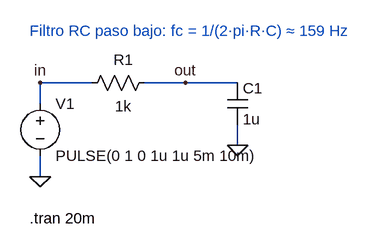
[diagram p0: schematic RC paso bajo.asc]
RC paso bajo.asc, the LTspice schematic file:
Version 4
SHEET 1 880 680
WIRE 80 0 0 0
WIRE 304 0 160 0
WIRE 0 32 0 0
WIRE 304 96 304 64
WIRE 0 144 0 112
FLAG 0 144 0
FLAG 304 96 0
FLAG 0 0 in
FLAG 224 0 out
SYMBOL voltage 0 16 R0
SYMATTR InstName V1
SYMATTR Value PULSE(0 1 0 1u 1u 5m 10m)
SYMBOL res 64 16 R270
WINDOW 0 36 64 VTop 2
WINDOW 3 -4 64 VBottom 2
SYMATTR InstName R1
SYMATTR Value 1k
SYMBOL cap 288 0 R0
SYMATTR InstName C1
SYMATTR Value 1u
TEXT -16 208 Left 2 !.tran 20m
TEXT -16 -80 Left 2 ;Filtro RC paso bajo: fc = 1/(2·pi·R·C) ≈ 159 Hz

The netlist it stands for:
* RC paso bajo.asc
V1 in 0 PULSE(0 1 0 1u 1u 5m 10m)
R1 in out 1k
C1 out 0 1u
.tran 20m
* Filtro RC paso bajo: fc = 1/(2·pi·R·C) ≈ 159 Hz
.backanno
.end